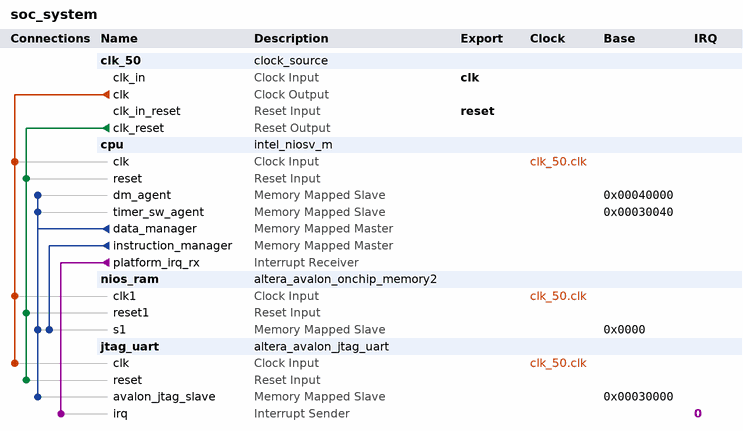
[diagram p0: system contents]
# Platform Designer (Qsys) system soc_system, Cyclone V 5CSEMA5F31C6
# Parameters at their usual value, and those the tool derives, are not listed.
package require -exact qsys 25.1
create_system soc_system
set_project_property DEVICE_FAMILY {Cyclone V}
set_project_property DEVICE 5CSEMA5F31C6

add_instance clk_50 clock_source 25.1
set_instance_parameter_value clk_50 clockFrequency 50000000
set_instance_parameter_value clk_50 resetSynchronousEdges DEASSERT

add_instance cpu intel_niosv_m 26.0.0
set_instance_parameter_value cpu enableAvalonInterface false
set_instance_parameter_value cpu enableDebugReset false
set_instance_parameter_value cpu enableECCFull false
set_instance_parameter_value cpu enableECCLite false
set_instance_parameter_value cpu hartId 0
set_instance_parameter_value cpu interruptMode 0
set_instance_parameter_value cpu pipelineArch true
set_instance_parameter_value cpu resetSlave nios_ram.s1

add_instance nios_ram altera_avalon_onchip_memory2 25.1
set_instance_parameter_value nios_ram dataWidth 32
set_instance_parameter_value nios_ram dualPort false
set_instance_parameter_value nios_ram initMemContent true
set_instance_parameter_value nios_ram initializationFileName nios_ram.hex
set_instance_parameter_value nios_ram memorySize 131072
set_instance_parameter_value nios_ram useNonDefaultInitFile true

add_instance jtag_uart altera_avalon_jtag_uart 25.1
set_instance_parameter_value jtag_uart simInteractiveOptions NO_INTERACTIVE_WINDOWS

# connections
add_connection clk_50.clk cpu.clk clock
add_connection clk_50.clk jtag_uart.clk clock
add_connection clk_50.clk nios_ram.clk1 clock
add_connection clk_50.clk_reset cpu.reset reset
add_connection clk_50.clk_reset jtag_uart.reset reset
add_connection clk_50.clk_reset nios_ram.reset1 reset
add_connection cpu.data_manager cpu.dm_agent avalon
set_connection_parameter_value cpu.data_manager/cpu.dm_agent baseAddress 0x00040000
add_connection cpu.data_manager cpu.timer_sw_agent avalon
set_connection_parameter_value cpu.data_manager/cpu.timer_sw_agent baseAddress 0x00030040
add_connection cpu.data_manager jtag_uart.avalon_jtag_slave avalon
set_connection_parameter_value cpu.data_manager/jtag_uart.avalon_jtag_slave baseAddress 0x00030000
add_connection cpu.data_manager nios_ram.s1 avalon
set_connection_parameter_value cpu.data_manager/nios_ram.s1 baseAddress 0x0000
add_connection cpu.instruction_manager nios_ram.s1 avalon
set_connection_parameter_value cpu.instruction_manager/nios_ram.s1 baseAddress 0x0000
add_connection cpu.platform_irq_rx jtag_uart.irq interrupt
set_connection_parameter_value cpu.platform_irq_rx/jtag_uart.irq irqNumber 0

# exported interfaces
add_interface clk clock sink
set_interface_property clk EXPORT_OF clk_50.clk_in
add_interface reset reset sink
set_interface_property reset EXPORT_OF clk_50.clk_in_reset

set_interconnect_requirement {$system} qsys_mm.clockCrossingAdapter HANDSHAKE
set_interconnect_requirement {$system} qsys_mm.enableEccProtection FALSE
set_interconnect_requirement {$system} qsys_mm.insertDefaultSlave FALSE
set_interconnect_requirement {$system} qsys_mm.maxAdditionalLatency 1

save_system soc_system.qsys
